# EasyEDA Pro project MSPM0G3507开发板（TI）.eprj

# Schematic Schematic1
Board Name: Board1; Create Date: 2024-08-09; Drawed: 坏厚米
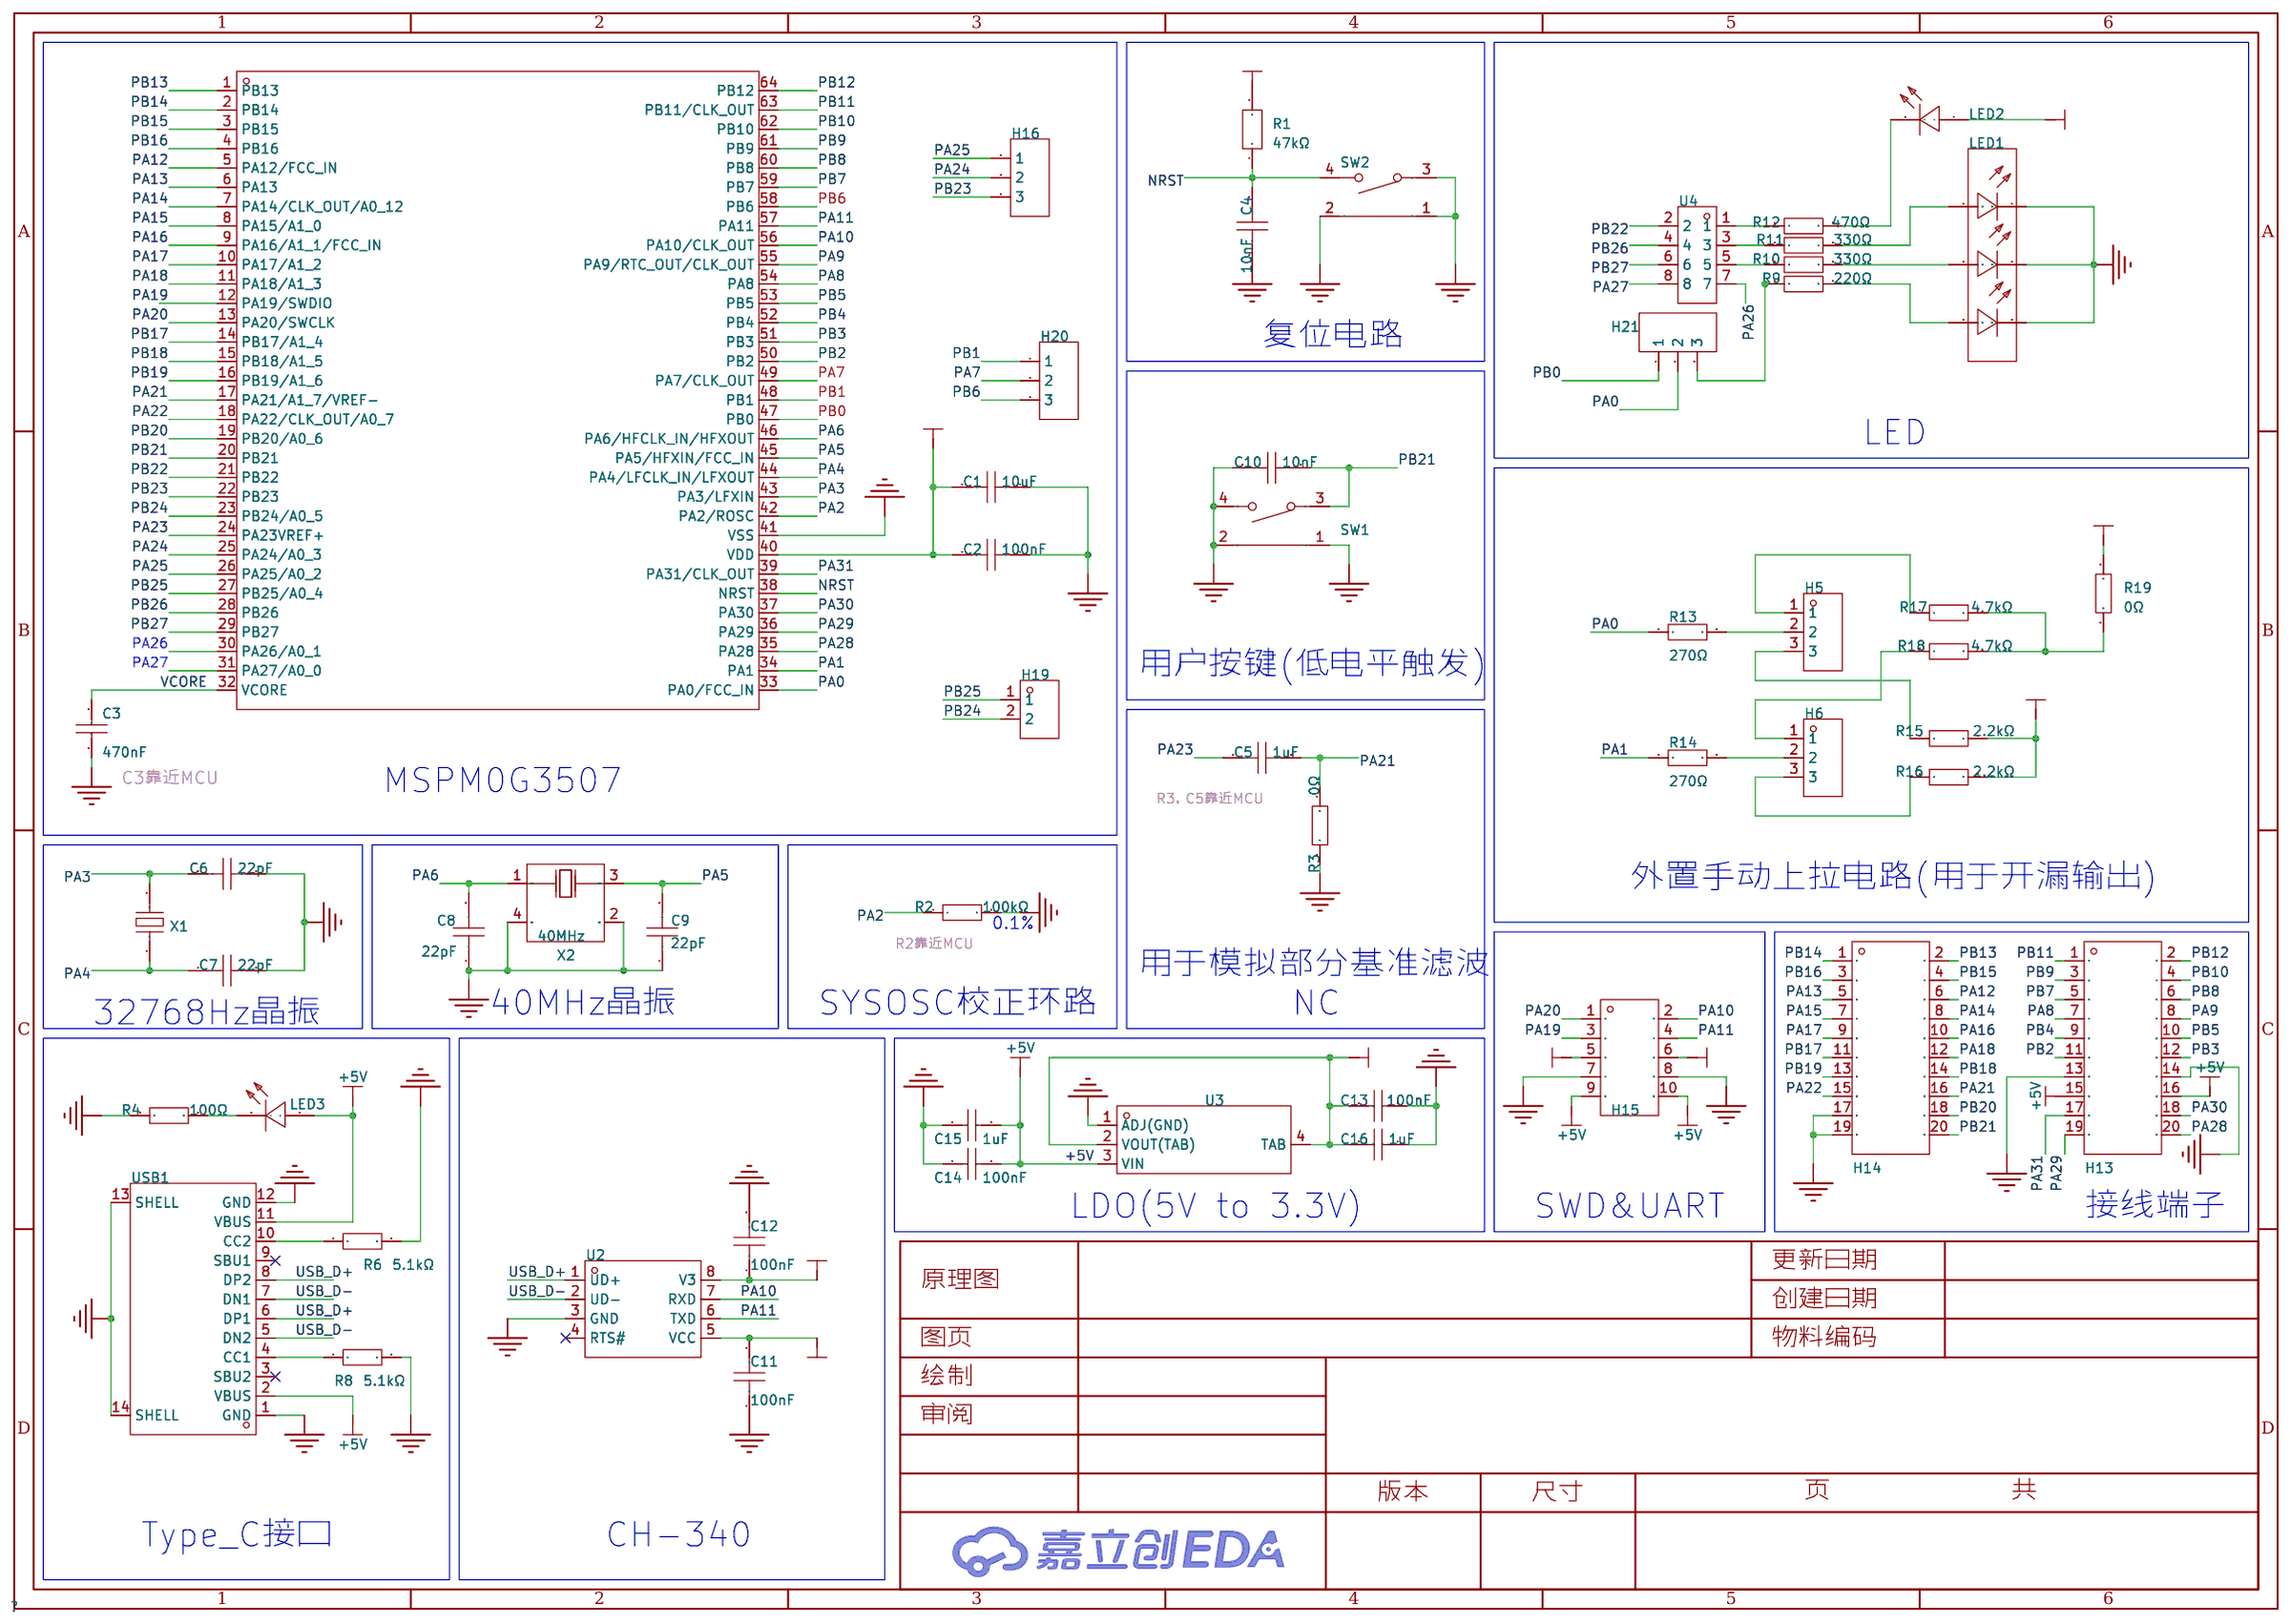
[diagram p0: schematic sheet]

## Parts
C1  10uF  [C0603]
C2  100nF  [C0603]
C3  470nF  [C0805]
C4  10nF  [C0805]
C5  1uF  [C0603]
C6  22pF  [C0805]
C7  22pF  [C0805]
C8  22pF  [C0805]
C9  22pF  [C0805]
C10  10nF  [C0805]
C11  100nF  [C0603]
C12  100nF  [C0603]
C13  100nF  [C0805]
C14  100nF  [C0805]
C15  1uF  [C0805]
C16  1uF  [C0805]
H5  PZ254V-11-03P  [HDR-TH_3P-P2.54-V-M]
H6  PZ254V-11-03P  [HDR-TH_3P-P2.54-V-M]
H13  X6521WV-2x10H-C60D30  [HDR-TH_20P-P2.54-V-M-R2-C10-S2.54]
H14  X6521WV-2x10H-C60D30  [HDR-TH_20P-P2.54-V-M-R2-C10-S2.54]
H15  PZ2.54-2*5  [HDR-TH_10P-P2.54-V-M-R2-C5-S2.54-1]
H16  2.54-1*3P针  [HDR-TH_3P-P2.54-V-M-1]
H19  KH-2.54PH180-1X2P-L11.5  [HDR-TH_2P-P2.54-V-M]
H20  2.54-1*3P针  [HDR-TH_3P-P2.54-V-M-1]
H21  2.54-1*3P针  [HDR-TH_3P-P2.54-V-M-1]
LED1  19-337/R6GHBHC-A01/2T  [LED-ARRAY-SMD_6P-L1.6-W1.6-TL]
LED2  NCD0805R1  [LED0805-R-RD]
LED3  NCD0805R1  [LED0805-R-RD]
R1  47kΩ  [R0805]
R2  100kΩ  [R0805]
R3  0Ω  [R0805]
R4  100Ω  [R0805]
R6  5.1kΩ  [R0603]
R8  5.1kΩ  [R0603]
R9  220Ω  [R0603]
R10  330Ω  [R0603]
R11  330Ω  [R0603]
R12  470Ω  [R0603]
R13  270Ω  [R0603]
R14  270Ω  [R0603]
R15  2.2kΩ  [R0805]
R16  2.2kΩ  [R0805]
R17  4.7kΩ  [R0603]
R18  4.7kΩ  [R0603]
R19  0Ω  [R0805]
SW1  TS24CA  [SW-SMD_TS24CA]
SW2  TS24CA  [SW-SMD_TS24CA]
U1  MSPM0G3507SPMR  [LQFP-64_L10.0-W10.0-P0.50-LS12.0-BL]
U2  CH340N  [SOP-8_L4.9-W3.9-P1.27-LS6.0-BL]
U3  AMS1117-3.3  [SOT-223-4_L6.5-W3.5-P2.30-LS7.0-BR]
U4  PZ2.54-2*4  [HDR-TH_8P-P2.54-V-M-R2-C4-S2.54]
USB1  TYPE-C 16PIN 2MD(073)  [USB-C-SMD_TYPE-C-6PIN-2MD-073]
X1  32.768kHz  [OSC-SMD_L3.2-W1.5]
X2  40MHz  [CRYSTAL-SMD_4P-L3.2-W2.5-BL]

## Library data of the parts
C1 = CL10A106MA8NRNC: 容值:10uF;精度:±20%;额定电压:25V;材质(温度系数):X5R;; LCSC Part Name: 10uF ±20% 25V; Supplier Part: C96446; Manufacturer: SAMSUNG(三星); Supplier Footprint: 0603; JLCPCB Part Class: 基础库; Datasheet: https://atta.szlcsc.com/upload/public/pdf/source/20160218/1457707763339.pdf; Supplier: LCSC; Tolerance: ±20%; Voltage Rated: 25V; Temperature Coefficient: X5R
C2 C11 C12 = CC0603KRX7R9BB104: 容值:100nF;精度:±10%;额定电压:50V;材质(温度系数):X7R;; LCSC Part Name: 100nF ±10% 50V; Supplier Part: C14663; Manufacturer: YAGEO(国巨); Supplier Footprint: 0603; JLCPCB Part Class: 基础库; Datasheet: https://atta.szlcsc.com/upload/public/pdf/source/20180910/C282072_33301C7F631E79921B82A8DAC6BCC5B3.pdf; Supplier: LCSC; Tolerance: ±10%; Voltage Rated: 50V; Temperature Coefficient: X7R
C3 = CC0805KKX7R9BB474: 容值:470nF;精度:±10%;额定电压:50V;材质(温度系数):X7R;; LCSC Part Name: 470nF ±10% 50V; Supplier Part: C106843; Manufacturer: YAGEO(国巨); Supplier Footprint: 0805; JLCPCB Part Class: 扩展库; Datasheet: https://atta.szlcsc.com/upload/public/pdf/source/20170919/C131031_1505787245477976978.pdf; Supplier: LCSC; Tolerance: ±10%; Voltage Rated: 50V; Temperature Coefficient: X7R
C4 C10 = CC0805KRX7R9BB103: 容值:10nF;精度:±10%;额定电压:50V;材质(温度系数):X7R;; LCSC Part Name: 10nF ±10% 50V; Supplier Part: C83170; Manufacturer: YAGEO(国巨); Supplier Footprint: 0805; JLCPCB Part Class: 扩展库; Datasheet: https://atta.szlcsc.com/upload/public/pdf/source/20170211/1486785656773.pdf; Supplier: LCSC; Tolerance: ±10%; Voltage Rated: 50V; Temperature Coefficient: X7R
C5 = CL10A105KB8NNNC: 容值:1uF;精度:±10%;额定电压:50V;材质(温度系数):X5R;; LCSC Part Name: 1uF ±10% 50V; Supplier Part: C15849; Manufacturer: SAMSUNG(三星); Supplier Footprint: 0603; JLCPCB Part Class: 基础库; Datasheet: https://atta.szlcsc.com/upload/public/pdf/source/20160218/1457707763339.pdf; Supplier: LCSC; Tolerance: ±10%; Voltage Rated: 50V; Temperature Coefficient: X5R
C6-C9 = CC0805FRNPO9BN220: 容值:22pF;精度:±1%;额定电压:50V;材质(温度系数):NP0;; LCSC Part Name: 22pF ±1% 50V; Supplier Part: C541515; Manufacturer: YAGEO(国巨); Supplier Footprint: 0805; JLCPCB Part Class: 扩展库; Datasheet: https://atta.szlcsc.com/upload/public/pdf/source/20200615/C541515_88B9BEA386E877B1A6E9F0AB558B8E25.pdf; Supplier: LCSC; Tolerance: ±1%; Voltage Rated: 50V; Temperature Coefficient: NP0
C13 C14 = CC0805KRX7R9BB104: 容值:100nF;精度:±10%;额定电压:50V;材质(温度系数):X7R;; LCSC Part Name: 100nF ±10% 50V; Supplier Part: C49678; Manufacturer: YAGEO(国巨); Supplier Footprint: 0805; JLCPCB Part Class: 基础库; Datasheet: https://atta.szlcsc.com/upload/public/pdf/source/20180224/C181747_15194369449651363981.pdf; Supplier: LCSC; Tolerance: ±10%; Voltage Rated: 50V; Temperature Coefficient: X7R
C15 C16 = CL21B105KBFNNNE: 容值:1uF;精度:±10%;额定电压:50V;材质(温度系数):X7R;; LCSC Part Name: 1uF ±10% 50V; Supplier Part: C28323; Manufacturer: SAMSUNG(三星); Supplier Footprint: 0805; JLCPCB Part Class: 基础库; Datasheet: https://atta.szlcsc.com/upload/public/pdf/source/20160218/1457707763339.pdf; Supplier: LCSC; Tolerance: ±10%; Voltage Rated: 50V; Temperature Coefficient: X7R
H5 H6 = PZ254V-11-03P: 插针结构:1x3P;间距:2.54mm;行距:-;圆针/方针:方针;安装类型:直插;排数:单排;总PIN位数:3P;额定电流:3A;额定电压:250V;配合针长度:6mm;塑高:2.5mm;端接针长度:3mm;工作温度范围:-40℃~+105℃;颜色:黑色;; LCSC Part Name: 间距:2.54mm 1x3P 直插 方针; Supplier Part: C2937625; Manufacturer: XFCN(兴飞); Supplier Footprint: 插件,P=2.54mm; JLCPCB Part Class: 扩展库; Datasheet: https://atta.szlcsc.com/upload/public/pdf/source/20200309/C492402_8335C3D49C4E4C618838D59BB1D024C1.pdf; Supplier: LCSC; Pin Structure: 1x3P; Pitch: 2.54mm; Circluar Pins/Square Pins: 方针; Mounting Type: 直插; Number of Rows: 单排; Number of Pins: 3P; Current Rating (Max): 3A; Voltage Rating (Max): 250V; Length of Mating Pin: 6mm; Insulation Height: 2.5mm; Length of End Connection Pin: 3mm; Operating Temperature Range: -40℃~+105℃; Color: 黑色
H13 H14 = X6521WV-2x10H-C60D30: 插针结构:2x10P;间距:2.54mm;行距:2.54mm;圆针/方针:方针;安装类型:-;排数:双排;总PIN位数:20P;额定电流:3A;额定电压:250V;配合针长度:-;塑高:2.5mm;端接针长度:-;触头材质:黄铜;触头镀层:金;工作温度范围:-40℃~+105℃;焊接温度(最大值):260℃;颜色:黑色;; LCSC Part Name: 2x10P 间距:2.54mm 方针; Supplier Part: C706900; Manufacturer: XKB Connection(中国星坤); Supplier Footprint: 插件,P=2.54mm; JLCPCB Part Class: 扩展库; Datasheet: https://atta.szlcsc.com/upload/public/pdf/source/20240506/64134E73DB35DA9A421C824B04192394.pdf; Supplier: LCSC; Pin Structure: 2x10P; Pitch: 2.54mm; Row Spacing: 2.54mm; Circluar Pins/Square Pins: 方针; Number of Rows: 双排; Number of Pins: 20P; Current Rating (Max): 3A; Voltage Rating (Max): 250V; Insulation Height: 2.5mm; Contact Material: 黄铜; Contact Plating: 金; Operating Temperature Range: -40℃~+105℃; Soldering Temperature(Max): 260℃; Color: 黑色
H15 = PZ2.54-2*5: 插针结构:2x5P;间距:2.54mm;排数:双排;总PIN位数:10P;; Supplier: LCSC; Supplier Part: C5156677; Manufacturer: ZHOURI(洲日); JLCPCB Part Class: 扩展库; Supplier Footprint: 插件,P=2.54mm; Datasheet: https://atta.szlcsc.com/upload/public/pdf/source/20220923/FF9D303E4B04AC19FF78D5B876650950.pdf; Pin Structure: 2x5P; Pitch: 2.54mm; Number of Rows: 双排; Number of Pins: 10P
H16 H20 H21 = 2.54-1*3P针: 插针结构:1x3P;间距:2.54mm;行距:-;圆针/方针:方针;安装类型:直插;排数:单排;总PIN位数:3P;额定电流:3A;额定电压:-;配合针长度:-;塑高:-;端接针长度:-;触头材质:-;触头镀层:-;工作温度范围:-40℃~+105℃;颜色:黑色;; LCSC Part Name: 间距:2.54mm 1x3P 直插 方针; Supplier Part: C49257; Manufacturer: BOOMELE(博穆精密); Supplier Footprint: 插件,P=2.54mm; JLCPCB Part Class: 扩展库; Datasheet: https://atta.szlcsc.com/upload/public/pdf/source/20221018/3E9408392E35E6F57A28985E5F7BF5C9.pdf; Supplier: LCSC; Pin Structure: 1x3P; Pitch: 2.54mm; Circluar Pins/Square Pins: 方针; Mounting Type: 直插; Number of Rows: 单排; Number of Pins: 3P; Current Rating (Max): 3A; Operating Temperature Range: -40℃~+105℃; Color: 黑色
H19 = KH-2.54PH180-1X2P-L11.5: 插针结构:1x2P;间距:2.54mm;行距:-;圆针/方针:方针;安装类型:直插;排数:单排;总PIN位数:2P;额定电流:3A;额定电压:-;配合针长度:6mm;塑高:2.5mm;端接针长度:3mm;触头材质:-;工作温度范围:-40℃~+105℃;颜色:黑色;; LCSC Part Name: 间距:2.54mm 1x2P 直插 方针; Supplier Part: C2905434; Manufacturer: kinghelm(金航标); Supplier Footprint: 插件,P=2.54mm; JLCPCB Part Class: 扩展库; Datasheet: https://atta.szlcsc.com/upload/public/pdf/source/20211019/75EAF9E0823F75B5BB441C07BAE9F5E6.pdf; Supplier: LCSC; Pin Structure: 1x2P; Pitch: 2.54mm; Circluar Pins/Square Pins: 方针; Mounting Type: 直插; Number of Rows: 单排; Number of Pins: 2P; Current Rating (Max): 3A; Length of Mating Pin: 6mm; Insulation Height: 2.5mm; Length of End Connection Pin: 3mm; Operating Temperature Range: -40℃~+105℃; Color: 黑色
LED1 = 19-337/R6GHBHC-A01/2T: LCSC Part Name: RGB三色; Supplier Part: C264519; Manufacturer: EVERLIGHT(亿光); Supplier Footprint: 0606; JLCPCB Part Class: 扩展库; Datasheet: https://atta.szlcsc.com/upload/public/pdf/source/20180817/C264519_7900C9A62A83B27DE10B455F7A4B7339.pdf; Supplier: LCSC
LED2 LED3 = NCD0805R1: 灯头类型:-;发光颜色:红色;正向电压(VF):1.6V~2.6V;功率:65mW;正向电流:20mA;主波长:615nm~630nm;二极管配置:独立二极管;透镜颜色:无色透明透镜;色温:-;发光强度:67mcd~195mcd;发光角度:130°;载带方式:-;工作温度:-30℃~+85℃;; Supplier Part: C84256; Manufacturer: 国星光电; Supplier Footprint: 0805; JLCPCB Part Class: 基础库; Datasheet: https://atta.szlcsc.com/upload/public/pdf/source/20200820/C84256_F0A75A43B3EAD75808600A0514C76B99.pdf; Supplier: LCSC; Emitted Color: 红色; Forward Voltage (VF): 1.6V~2.6V; Power Dissipation: 65mW; Forward Current: 20mA; Dominant Wavelength: 615nm~630nm; Diode Configuration: 独立二极管; Lens Color: 无色透明透镜; Luminous Intensity: 67mcd~195mcd; Viewing Angle: 130°; Operating Temperature: -30℃~+85℃
R1 = SCR0805F47K: 电阻类型:厚膜电阻;阻值:47kΩ;精度:±1%;功率:125mW;最大工作电压:150V;; LCSC Part Name: 厚膜电阻 47kΩ ±1% 125mW; Supplier Part: C3016793; Manufacturer: VO(翔胜); Supplier Footprint: 0805; JLCPCB Part Class: 扩展库; Datasheet: https://atta.szlcsc.com/upload/public/pdf/source/20220513/247AF9639BA21CF93567DC289CCC6A22.pdf; Supplier: LCSC; Type: 厚膜电阻; Tolerance: ±1%; Power(Watts): 125mW; Overload Voltage (Max): 150V; Operating Temperature Range: -55℃~+155℃
R2 = RT0805BRD07100KL: 电阻类型:薄膜电阻;阻值:100kΩ;精度:±0.1%;功率:125mW;最大工作电压:150V;温度系数:±25ppm/℃;; LCSC Part Name: 薄膜电阻 100kΩ ±0.1% 125mW; Supplier Part: C122537; Manufacturer: YAGEO(国巨); Supplier Footprint: 0805; JLCPCB Part Class: 扩展库; Datasheet: https://atta.szlcsc.com/upload/public/pdf/source/20170721/C122537_1500619325668834091.pdf; Supplier: LCSC; Type: 薄膜电阻; Tolerance: ±0.1%; Power(Watts): 125mW; Overload Voltage (Max): 150V; Temperature Coefficient: ±25ppm/℃; Operating Temperature Range: -55℃~+155℃
R3 R19 = 0805W8F0000T5E: 电阻类型:厚膜电阻;阻值:0Ω;精度:±1%;功率:125mW;最大工作电压:150V;温度系数:±800ppm/℃;; LCSC Part Name: 0Ω ±1% 125mW 厚膜电阻; Supplier Part: C17477; Manufacturer: UNI-ROYAL(厚声); Supplier Footprint: 0805; JLCPCB Part Class: 基础库; Datasheet: https://atta.szlcsc.com/upload/public/pdf/source/20200306/C422600_1E6D84923E4A46A82E41ADD87F860B5C.pdf; Supplier: LCSC; Type: 厚膜电阻; Tolerance: ±1%; Power(Watts): 125mW; Overload Voltage (Max): 150V; Temperature Coefficient: ±800ppm/℃; Operating Temperature Range: -55℃~+155℃
R4 = 0805W8F1000T5E: 电阻类型:厚膜电阻;阻值:100Ω;精度:±1%;功率:125mW;最大工作电压:150V;温度系数:±100ppm/℃;; LCSC Part Name: 100Ω ±1% 125mW 厚膜电阻; Supplier Part: C17408; Manufacturer: UNI-ROYAL(厚声); Supplier Footprint: 0805; JLCPCB Part Class: 基础库; Datasheet: https://atta.szlcsc.com/upload/public/pdf/source/20200306/C422600_1E6D84923E4A46A82E41ADD87F860B5C.pdf; Supplier: LCSC; Type: 厚膜电阻; Tolerance: ±1%; Power(Watts): 125mW; Overload Voltage (Max): 150V; Temperature Coefficient: ±100ppm/℃; Operating Temperature Range: -55℃~+155℃
R6 R8 = 0603WAF5101T5E: 电阻类型:厚膜电阻;阻值:5.1kΩ;精度:±1%;功率:100mW;最大工作电压:75V;温度系数:±100ppm/℃;; LCSC Part Name: 5.1kΩ ±1% 100mW 厚膜电阻; Supplier Part: C23186; Manufacturer: UNI-ROYAL(厚声); Supplier Footprint: 0603; JLCPCB Part Class: 基础库; Datasheet: https://atta.szlcsc.com/upload/public/pdf/source/20200306/C422600_1E6D84923E4A46A82E41ADD87F860B5C.pdf; Supplier: LCSC; Type: 厚膜电阻; Tolerance: ±1%; Power(Watts): 100mW; Overload Voltage (Max): 75V; Temperature Coefficient: ±100ppm/℃; Operating Temperature Range: -55℃~+155℃
R9 = 0603WAF2200T5E: 电阻类型:厚膜电阻;阻值:220Ω;精度:±1%;功率:100mW;最大工作电压:75V;温度系数:±100ppm/℃;; LCSC Part Name: 220Ω ±1% 100mW 厚膜电阻; Supplier Part: C22962; Manufacturer: UNI-ROYAL(厚声); Supplier Footprint: 0603; JLCPCB Part Class: 基础库; Datasheet: https://atta.szlcsc.com/upload/public/pdf/source/20200306/C422600_1E6D84923E4A46A82E41ADD87F860B5C.pdf; Supplier: LCSC; Type: 厚膜电阻; Tolerance: ±1%; Power(Watts): 100mW; Overload Voltage (Max): 75V; Temperature Coefficient: ±100ppm/℃; Operating Temperature Range: -55℃~+155℃
R10 R11 = 0603WAF3300T5E: 电阻类型:厚膜电阻;阻值:330Ω;精度:±1%;功率:100mW;最大工作电压:75V;温度系数:±100ppm/℃;; LCSC Part Name: 330Ω ±1% 100mW 厚膜电阻; Supplier Part: C23138; Manufacturer: UNI-ROYAL(厚声); Supplier Footprint: 0603; JLCPCB Part Class: 基础库; Datasheet: https://atta.szlcsc.com/upload/public/pdf/source/20200306/C422600_1E6D84923E4A46A82E41ADD87F860B5C.pdf; Supplier: LCSC; Type: 厚膜电阻; Tolerance: ±1%; Power(Watts): 100mW; Overload Voltage (Max): 75V; Temperature Coefficient: ±100ppm/℃; Operating Temperature Range: -55℃~+155℃
R12 = 0603WAF4700T5E: 电阻类型:厚膜电阻;阻值:470Ω;精度:±1%;功率:100mW;最大工作电压:75V;温度系数:±100ppm/℃;; LCSC Part Name: 470Ω ±1% 100mW 厚膜电阻; Supplier Part: C23179; Manufacturer: UNI-ROYAL(厚声); Supplier Footprint: 0603; JLCPCB Part Class: 基础库; Datasheet: https://atta.szlcsc.com/upload/public/pdf/source/20200306/C422600_1E6D84923E4A46A82E41ADD87F860B5C.pdf; Supplier: LCSC; Type: 厚膜电阻; Tolerance: ±1%; Power(Watts): 100mW; Overload Voltage (Max): 75V; Temperature Coefficient: ±100ppm/℃; Operating Temperature Range: -55℃~+155℃
R13 R14 = 0603WAF2700T5E: 电阻类型:厚膜电阻;阻值:270Ω;精度:±1%;功率:100mW;最大工作电压:75V;温度系数:±100ppm/℃;; LCSC Part Name: 270Ω ±1% 100mW 厚膜电阻; Supplier Part: C22966; Manufacturer: UNI-ROYAL(厚声); Supplier Footprint: 0603; JLCPCB Part Class: 基础库; Datasheet: https://atta.szlcsc.com/upload/public/pdf/source/20200306/C422600_1E6D84923E4A46A82E41ADD87F860B5C.pdf; Supplier: LCSC; Type: 厚膜电阻; Tolerance: ±1%; Power(Watts): 100mW; Overload Voltage (Max): 75V; Temperature Coefficient: ±100ppm/℃; Operating Temperature Range: -55℃~+155℃
R15 R16 = 0805W8F2201T5E: 电阻类型:厚膜电阻;阻值:2.2kΩ;精度:±1%;功率:125mW;最大工作电压:150V;温度系数:±100ppm/℃;; LCSC Part Name: 2.2kΩ ±1% 125mW 厚膜电阻; Supplier Part: C17520; Manufacturer: UNI-ROYAL(厚声); Supplier Footprint: 0805; JLCPCB Part Class: 基础库; Datasheet: https://atta.szlcsc.com/upload/public/pdf/source/20200306/C422600_1E6D84923E4A46A82E41ADD87F860B5C.pdf; Supplier: LCSC; Type: 厚膜电阻; Tolerance: ±1%; Power(Watts): 125mW; Overload Voltage (Max): 150V; Temperature Coefficient: ±100ppm/℃; Operating Temperature Range: -55℃~+155℃
R17 R18 = RC0603FR-074K7L: 电阻类型:厚膜电阻;阻值:4.7kΩ;精度:±1%;功率:100mW;最大工作电压:75V;温度系数:±100ppm/℃;; LCSC Part Name: 厚膜电阻 4.7kΩ ±1% 100mW; Supplier Part: C99782; Manufacturer: YAGEO(国巨); Supplier Footprint: 0603; JLCPCB Part Class: 扩展库; Datasheet: https://atta.szlcsc.com/upload/public/pdf/source/20180224/C181757_15194369480721363983.pdf; Supplier: LCSC; Type: 厚膜电阻; Tolerance: ±1%; Power(Watts): 100mW; Overload Voltage (Max): 75V; Temperature Coefficient: ±100ppm/℃; Operating Temperature Range: -55℃~+155℃
SW1 SW2 = TS24CA: 电路结构:单刀单掷;按钮形状:矩形按钮;安装方式:卧贴;开关长度:4.55mm;开关宽度:1.8mm;开关高度:3.5mm;触点电流:50mA;额定电压(DC):12V;带灯:-;机械寿命:-;; LCSC Part Name: 4.55*1.8*3.5mm 卧贴 轻触开关; Supplier Part: C393942; Manufacturer: SHOU HAN(首韩); Supplier Footprint: SMD; JLCPCB Part Class: 扩展库; Datasheet: https://atta.szlcsc.com/upload/public/pdf/source/20190521/C393942_591A9E318887EFA4274D34029981AD99.pdf; Supplier: LCSC; Circuit: 单刀单掷; Actuator Style: 矩形按钮; Mounting Style: 卧贴; Switch Length: 4.55mm; Switch Width: 1.8mm; Switch Height: 3.5mm; Contact Current: 50mA; Voltage Rating (DC): 12V
U1 = MSPM0G3507SPMR_C22389960: Supplier Part: C22389960; Manufacturer: TI(德州仪器); Supplier Footprint: LQFP-64(10x10); JLCPCB Part Class: 扩展库; Datasheet: https://atta.szlcsc.com/upload/public/pdf/source/20240621/D7254EAE03B6DB9B67DC0EA221DC405D.pdf; Supplier: LCSC
U2 = CH340N: LCSC Part Name: USB转串口芯片 CH340; Supplier Part: C2977777; Manufacturer: WCH(南京沁恒); Supplier Footprint: SOP-8; JLCPCB Part Class: 扩展库; Datasheet: https://atta.szlcsc.com/upload/public/pdf/source/20230530/6E401E9554E9F5311886CC8B3F89B62E.pdf; Supplier: LCSC
U3 = AMS1117-3.3_C347222: 输出类型:固定;最大输入电压:12V;输出电压:3.3V;最大输出电流:1A;电源纹波抑制比(PSRR):60dB@(120Hz);输出极性:正极;; LCSC Part Name: 输出:3.3V 电流:1A 耐压:12V; Supplier Part: C347222; Manufacturer: UMW(友台半导体); Supplier Footprint: SOT-223; JLCPCB Part Class: 扩展库; Datasheet: https://atta.szlcsc.com/upload/public/pdf/source/20231109/155D79A26D9DB04352555A58D5969DC8.pdf; Supplier: LCSC; Output Type: 固定; Maximum Input Voltage: 12V; Output Voltage: 3.3V; MAX Output Current: 1A; Power Supply Rejection Ratio (PSRR): 60dB@(120Hz); Dropout Voltage: 1.3V@(1A); Output Polarity: 正极; Number of Outputs: 1
U4 = PZ2.54-2*4: 插针结构:2x4P;间距:2.54mm;排数:双排;总PIN位数:8P;; Supplier Part: C5156676; Manufacturer: ZHOURI(洲日); Supplier Footprint: 插件,P=2.54mm; JLCPCB Part Class: 扩展库; Datasheet: https://atta.szlcsc.com/upload/public/pdf/source/20220923/0E7A4A94740FFD503E2D73F36F92C1EA.pdf; Supplier: LCSC; Pin Structure: 2x4P; Pitch: 2.54mm; Number of Rows: 双排; Number of Pins: 8P
USB1 = TYPE-C 16PIN 2MD(073): 连接器类型:Type-C;标准:-;公母:母;端口数量:1;触点数量:16P;安装方式:卧贴;额定电流 - 电源:5A;工作温度范围:-25℃~+85℃;; LCSC Part Name: Type-C 母 卧贴; Supplier Part: C2765186; Manufacturer: SHOU HAN(首韩); Supplier Footprint: SMD; JLCPCB Part Class: 扩展库; Datasheet: https://atta.szlcsc.com/upload/public/pdf/source/20211123/39B17C16241EAC15C5E277BDA434118E.pdf; Supplier: LCSC; Connector Type: Type-C; Gender: 母; Number of Ports: 1; Number of Contacts: 16P; Mounting Style: 卧贴; Current Rating - Power (Max): 5A; Operating Temperature Range: -25℃~+85℃
X1 = X321532768KGD2SI: 晶振类型:贴片晶振;频率:32.768kHz;常温频差:±20ppm;外接负载电容:12.5pF;频率稳定度(全温):-;; LCSC Part Name: 32.768kHz ±20ppm 12.5pF; Supplier Part: C620155; Manufacturer: YXC(扬兴晶振); Supplier Footprint: SMD3215-2P; JLCPCB Part Class: 扩展库; Datasheet: https://atta.szlcsc.com/upload/public/pdf/source/20240329/3A7650FD985DD0DE85694D3785AB4916.pdf; Supplier: LCSC; Crystal Type: 贴片晶振; Normal temperature Frequency Tolerance: ±20ppm; External load capacitor: 12.5pF; Operating Temperature: -40℃~+85℃
X2 = S3240000121040: 晶振类型:贴片晶振;频率:40MHz;常温频差:±10ppm;外接负载电容:12pF;; LCSC Part Name: 40MHz ±10ppm 12pF; Supplier Part: C426989; Manufacturer: JGHC(晶光华); Supplier Footprint: SMD3225-4P; JLCPCB Part Class: 扩展库; Datasheet: https://atta.szlcsc.com/upload/public/pdf/source/20191012/C431172_99BCDFC5E39E114929AE7F9C9DED2B9F.pdf; Supplier: LCSC; Crystal Type: 贴片晶振; Normal temperature Frequency Tolerance: ±10ppm; External load capacitor: 12pF; Equivalent Series Resistance (ESR): 40Ω; Operating Temperature: -40℃~+85℃

## Nets
3V3: C1.2 C2.2 C11.2 C12.1 C13.2 C16.2 H15.5 H15.6 LED2.1(+) R1.2 R15.2 R16.2 U1.40(VDD) U2.5(VCC) U2.8(V3) U3.2(VOUT(TAB)) U3.4(TAB)
+5V: C14.1 C15.1 H13.15 H13.16 H15.9 H15.10 LED3.1(+) R19.2 U3.3(VIN) USB1.2(VBUS) USB1.11(VBUS)
GND: C1.1 C2.1 C3.1 C4.1 C6.2 C7.2 C8.1 C9.1 C10.2 C11.1 C12.2 C13.1 C14.2 C15.2 C16.1 H13.13 H13.14 H14.17 H14.19 H15.7 H15.8 LED1.1(-B) LED1.2(-R) LED1.3(-G) R2.2 R3.1 R4.1 R6.2 R8.2 SW1.1 SW1.2 SW1.4 SW2.1 SW2.2 SW2.3 U1.41(VSS) U2.3(GND) U3.1(ADJ(GND)) USB1.1(GND) USB1.12(GND) USB1.13(SHELL) USB1.14(SHELL) X2.2(GND) X2.4(OSC1)
NRST: C4.2 R1.1 SW2.4 U1.38(NRST)
PA0: H21.2 R13.1 U1.33(PA0/FCC_IN)
PA1: R14.1 U1.34(PA1)
PA2: R2.1 U1.42(PA2/ROSC)
PA3: C6.1 U1.43(PA3/LFXIN) X1.2
PA4: C7.1 U1.44(PA4/LFCLK_IN/LFXOUT) X1.1
PA5: C9.2 U1.45(PA5/HFXIN/FCC_IN) X2.3(OSC2)
PA6: C8.2 U1.46(PA6/HFCLK_IN/HFXOUT) X2.1(GND)
PA7: H20.2 U1.49(PA7/CLK_OUT)
PA8: H13.7 U1.54(PA8)
PA9: H13.8 U1.55(PA9/RTC_OUT/CLK_OUT)
PA10: H15.2 U1.56(PA10/CLK_OUT) U2.7(RXD)
PA11: H15.4 U1.57(PA11) U2.6(TXD)
PA12: H14.6 U1.5(PA12/FCC_IN)
PA13: H14.5 U1.6(PA13)
PA14: H14.8 U1.7(PA14/CLK_OUT/A0_12)
PA15: H14.7 U1.8(PA15/A1_0)
PA16: H14.10 U1.9(PA16/A1_1/FCC_IN)
PA17: H14.9 U1.10(PA17/A1_2)
PA18: H14.12 U1.11(PA18/A1_3)
PA19: H15.3 U1.12(PA19/SWDIO)
PA20: H15.1 U1.13(PA20/SWCLK)
PA21: C5.2 H14.16 R3.2 U1.17(PA21/A1_7/VREF-)
PA22: H14.15 U1.18(PA22/CLK_OUT/A0_7)
PA23: C5.1 U1.24(PA23VREF+)
PA24: H16.2 U1.25(PA24/A0_3)
PA25: H16.1 U1.26(PA25/A0_2)
PA26: U1.30(PA26/A0_1) U4.7
PA27: U1.31(PA27/A0_0) U4.8
PA28: H13.20 U1.35(PA28)
PA29: H13.19 U1.36(PA29)
PA30: H13.18 U1.37(PA30)
PA31: H13.17 U1.39(PA31/CLK_OUT)
PB0: H21.1 U1.47(PB0)
PB1: H20.1 U1.48(PB1)
PB2: H13.11 U1.50(PB2)
PB3: H13.12 U1.51(PB3)
PB4: H13.9 U1.52(PB4)
PB5: H13.10 U1.53(PB5)
PB6: H20.3 U1.58(PB6)
PB7: H13.5 U1.59(PB7)
PB8: H13.6 U1.60(PB8)
PB9: H13.3 U1.61(PB9)
PB10: H13.4 U1.62(PB10)
PB11: H13.1 U1.63(PB11/CLK_OUT)
PB12: H13.2 U1.64(PB12)
PB13: H14.2 U1.1(PB13)
PB14: H14.1 U1.2(PB14)
PB15: H14.4 U1.3(PB15)
PB16: H14.3 U1.4(PB16)
PB17: H14.11 U1.14(PB17/A1_4)
PB18: H14.14 U1.15(PB18/A1_5)
PB19: H14.13 U1.16(PB19/A1_6)
PB20: H14.18 U1.19(PB20/A0_6)
PB21: C10.1 H14.20 SW1.3 U1.20(PB21)
PB22: U1.21(PB22) U4.2
PB23: H16.3 U1.22(PB23)
PB24: H19.2 U1.23(PB24/A0_5)
PB25: H19.1 U1.27(PB25/A0_4)
PB26: U1.28(PB26) U4.4
PB27: U1.29(PB27) U4.6
USB_D+: U2.1(UD+) USB1.6(DP1) USB1.8(DP2)
USB_D-: U2.2(UD-) USB1.5(DN2) USB1.7(DN1)
VCORE: C3.2 U1.32(VCORE)
$1N5655: LED2.2(-) R12.2
$1N5659: H5.2 R13.2
$1N5660: H6.2 R14.2
$1N5661: H6.1 R18.1
$1N5662: H5.3 R15.1
$1N5663: H6.3 R16.1
$1N5664: H5.1 R17.1
$1N5665: R17.2 R18.2 R19.1
$1N8212: R6.1 USB1.10(CC2)
$1N8214: R8.1 USB1.4(CC1)
$1N9211: LED3.2(-) R4.2
$1N9475: LED1.4(+B) R11.2
$1N9580: R12.1 U4.1
$1N9585: R11.1 U4.3
$1N9590: R10.1 U4.5
$1N9737: LED1.5(+R) R10.2
$1N9759: LED1.6(+G) R9.2
$1N18300: H21.3 R9.1

Not connected (* = marked no-connect by the designer): U2 4(RTS#)*; USB1 3(SBU2)* 9(SBU1)*

## Notes on the sheet
- 复位电路
- LED
- 用户按键(低电平触发)
- C3靠近MCU
- MSPM0G3507
- R3，C5靠近MCU
- 外置手动上拉电路(用于开漏输出)
- 0.1%
- R2靠近MCU
- 用于模拟部分基准滤波
- 32768Hz晶振
- 40MHz晶振
- SYSOSC校正环路
- NC
- LDO(5V to 3.3V)
- SWD&UART
- 接线端子
- Type_C接口
- CH-340

# Board PCB1
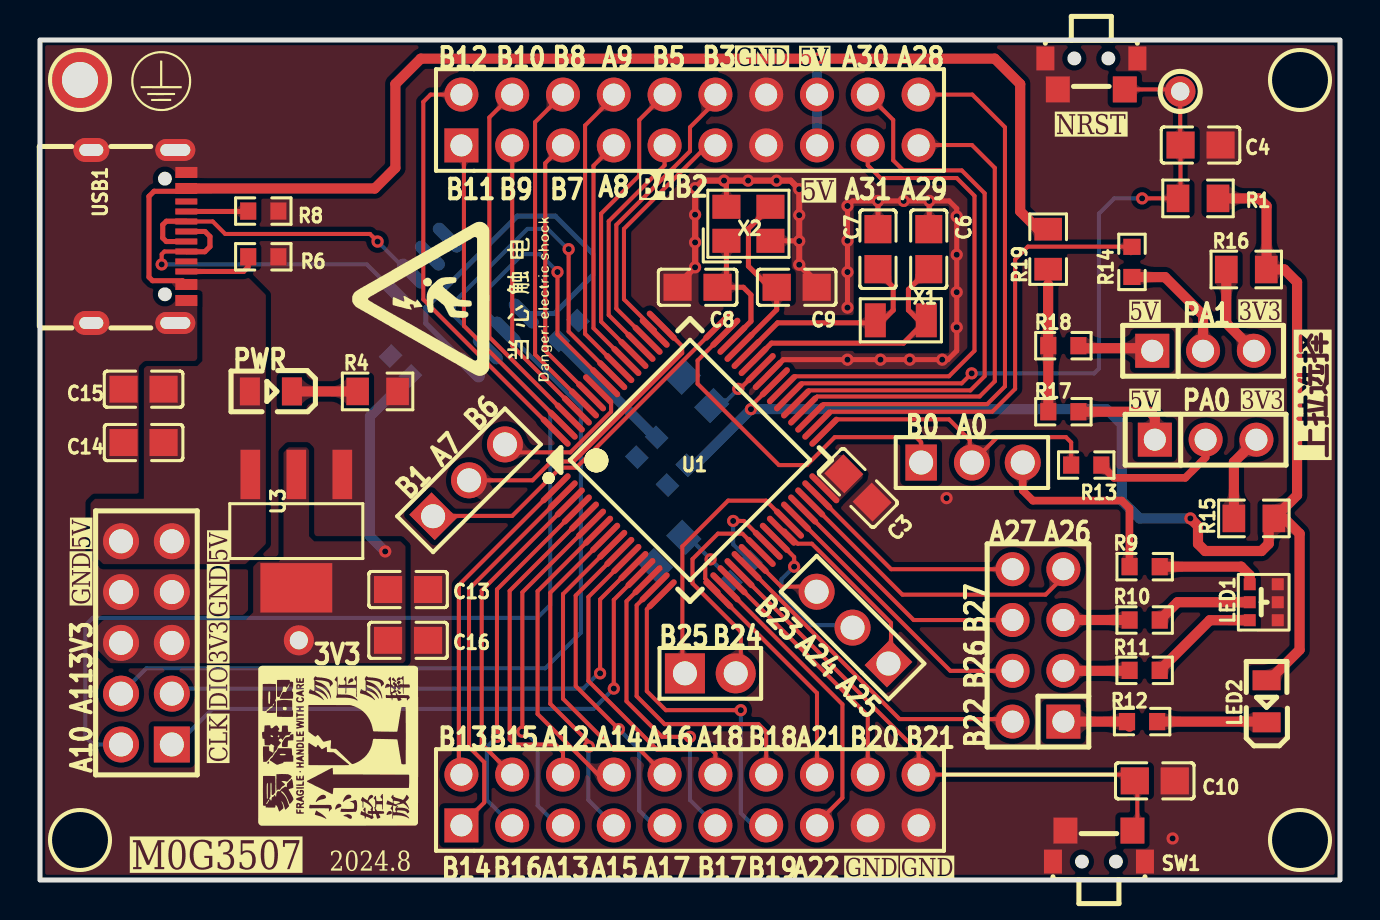
[diagram p1: board, top side]
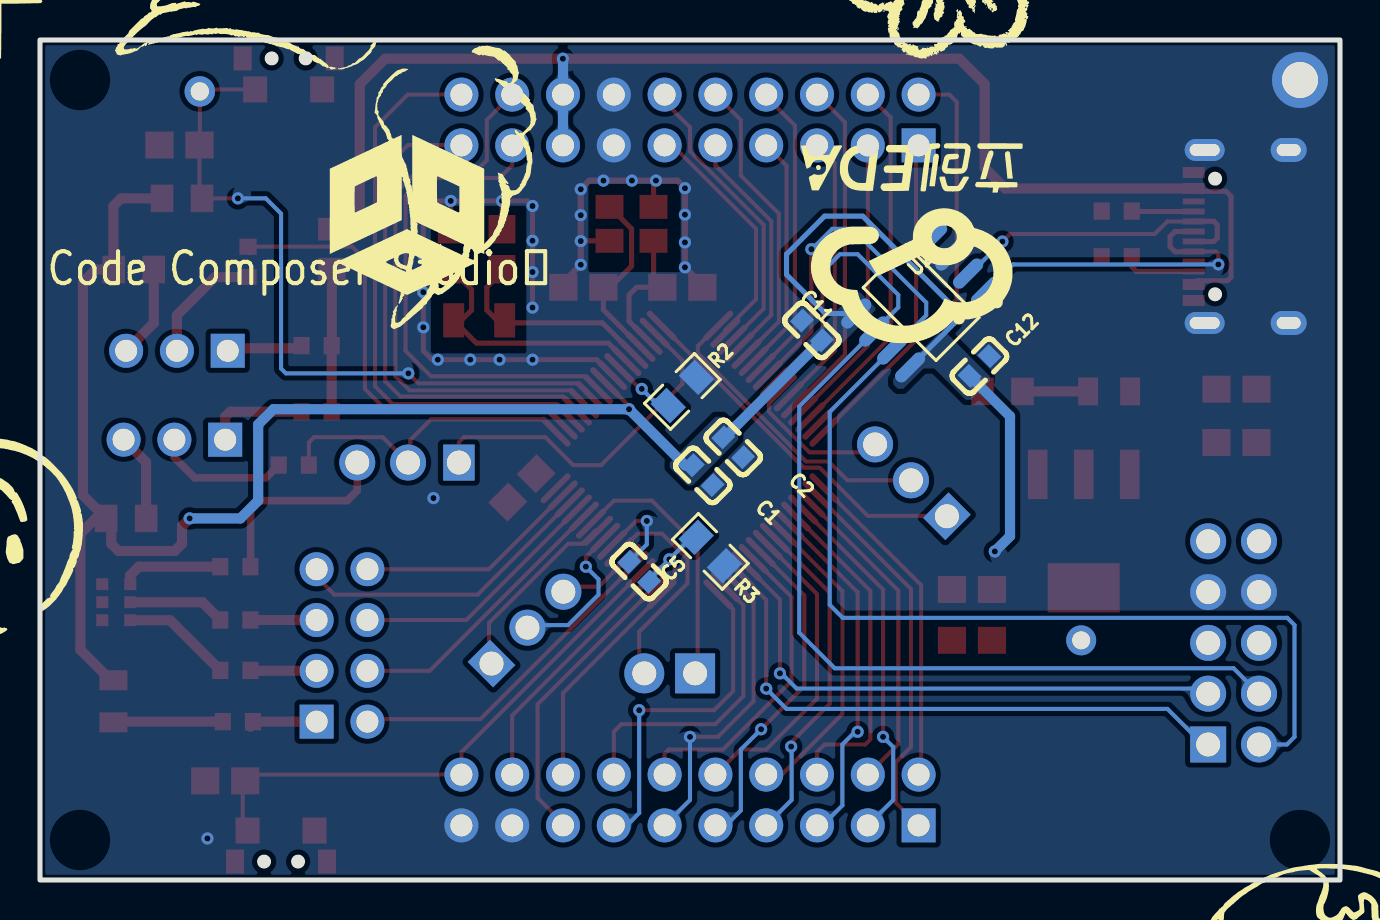
[diagram p2: board, bottom side, seen from below]

Outline 65 x 42 mm; copper layers: Top Layer, Bottom Layer. Coordinates in mm from the lower left corner of the outline.
Outline path: rectangle 0,42 65,0
Stack: Top Layer 0.035mm / Dielectric1 1.51mm FR4 er 4.5 / Bottom Layer 0.035mm

## Design rules (mm)
template: 自定义配置
spacing copperThickness1oz (default): track to track 0.102, other pairs 0.152 to 0.3
spacing copperThickness2oz: track to track 0.203, other pairs 0.152 to 0.3
track width copperThickness1oz (default): min 0.127, default 0.254, max 2.54
track width copperThickness2oz: min 0.203, default 0.254, max 2.54
differential pair differentialPair (default): width min 0.127, default 0.254, max 2.54; gap min 0.152, default 0.152
via viaSize (default): diameter min 0.5, default 0.61, max 10; hole min 0.3, default 0.305, max 6.3

## Placement (name value [footprint] x y rotation side)
C1  10uF  [C0603]  31.87 20.24 45 bottom
C2  100nF  [C0603]  30.34 21.64 45 bottom
C3  470nF  [C0805]  40.9 19.6 135 top
C4  10nF  [C0805]  58.03 36.75 180 top
C5  1uF  [C0603]  35.04 15.41 225 bottom
C6  22pF  [C0805]  44.44 31.54 90 top
C7  22pF  [C0805]  41.9 31.54 90 top
C8  22pF  [C0805]  32.88 29.64 0 top
C9  22pF  [C0805]  37.83 29.64 180 top
C10  10nF  [C0805]  55.74 4.96 0 top
C11  100nF  [C0603]  26.4 27.48 225 bottom
C12  100nF  [C0603]  18.02 25.7 135 bottom
C13  100nF  [C0805]  18.4 14.52 180 top
C14  100nF  [C0805]  5.18 21.87 180 top
C15  1uF  [C0805]  5.18 24.54 180 top
C16  1uF  [C0805]  18.4 11.98 180 top
H5  PZ254V-11-03P  [HDR-TH_3P-P2.54-V-M]  58.28 22.02 0 top
H6  PZ254V-11-03P  [HDR-TH_3P-P2.54-V-M]  58.15 26.46 0 top
H13  X6521WV-2x10H-C60D30  [HDR-TH_20P-P2.54-V-M-R2-C10-S2.54]  32.5 38 0 top
H14  X6521WV-2x10H-C60D30  [HDR-TH_20P-P2.54-V-M-R2-C10-S2.54]  32.5 4 0 top
H15  PZ2.54-2*5  [HDR-TH_10P-P2.54-V-M-R2-C5-S2.54-1]  5.32 11.86 90 top
H16  2.54-1*3P针  [HDR-TH_3P-P2.54-V-M-1]  40.63 12.62 135 top
H19  KH-2.54PH180-1X2P-L11.5  [HDR-TH_2P-P2.54-V-M]  33.52 10.33 0 top
H20  2.54-1*3P针  [HDR-TH_3P-P2.54-V-M-1]  21.45 19.98 45 top
H21  2.54-1*3P针  [HDR-TH_3P-P2.54-V-M-1]  46.6 20.87 0 top
LED1  19-337/R6GHBHC-A01/2T  [LED-ARRAY-SMD_6P-L1.6-W1.6-TL]  61.19 13.89 180 top
LED2  NCD0805R1  [LED0805-R-RD]  61.33 8.94 90 top
LED3  NCD0805R1  [LED0805-R-RD]  11.54 24.43 180 top
NOREF  -  [Pad_e2120]  12.94 11.98 0 top
NOREF#2  -  [Pad_e439]  57.01 39.43 0 top
NOREF#3  -  [Pad_e1911]  2 40 0 top
R1  47kΩ  [R0805]  57.9 34.08 0 top
R2  100kΩ  [R0805]  32.88 24.43 135 bottom
R3  0Ω  [R0805]  31.48 16.43 45 bottom
R4  100Ω  [R0805]  16.88 24.43 180 top
R6  5.1kΩ  [R0603]  11.16 31.16 0 top
R8  5.1kΩ  [R0603]  11.16 33.45 0 top
R9  220Ω  [R0603]  55.23 15.67 0 top
R10  330Ω  [R0603]  55.23 13 0 top
R11  330Ω  [R0603]  55.23 10.48 0 top
R12  470Ω  [R0603]  55.11 7.92 0 top
R13  270Ω  [R0603]  52.31 20.75 0 top
R14  270Ω  [R0603]  54.6 30.91 270 top
R15  2.2kΩ  [R0805]  60.69 18.08 0 top
R16  2.2kΩ  [R0805]  60.31 30.53 0 top
R17  4.7kΩ  [R0603]  51.17 23.41 180 top
R18  4.7kΩ  [R0603]  51.17 26.72 180 top
R19  0Ω  [R0805]  50.41 31.54 90 top
SW1  TS24CA  [SW-SMD_TS24CA]  52.95 1.7 180 top
SW2  TS24CA  [SW-SMD_TS24CA]  52.57 40.3 0 top
U1  MSPM0G3507SPMR  [LQFP-64_L10.0-W10.0-P0.50-LS12.0-BL]  32.5 21 315 top
U2  CH340N  [SOP-8_L4.9-W3.9-P1.27-LS6.0-BL]  20.94 28.87 45 bottom
U3  AMS1117-3.3  [SOT-223-4_L6.5-W3.5-P2.30-LS7.0-BR]  12.81 17.44 90 top
U4  PZ2.54-2*4  [HDR-TH_8P-P2.54-V-M-R2-C4-S2.54]  49.9 11.73 90 top
USB1  TYPE-C 16PIN 2MD(073)  [USB-C-SMD_TYPE-C-6PIN-2MD-073]  4.94 32.18 270 top
X1  32.768kHz  [OSC-SMD_L3.2-W1.5]  43.04 27.98 0 top
X2  40MHz  [CRYSTAL-SMD_4P-L3.2-W2.5-BL]  35.42 32.81 0 top

## Footprints (pads in the part's own frame, mm; a bottom-side part is the same pattern mirrored in y, then rotated)
C0603
  rect 0.8x0.9 smd: 1(-0.7,0) 2(0.7,0)
C0805
  rect 1.41x1.35 smd: 1(-1,0) 2(1,0)
CRYSTAL-SMD_4P-L3.2-W2.5-BL
  rect 1.4x1.2 smd: 1(-1.1,-0.85) 2(1.1,-0.85) 3(1.1,0.85) 4(-1.1,0.85)
HDR-TH_2P-P2.54-V-M
  rect 2x2 hole 1.2: 1(-1.27,0)
  round 2 hole 1.2: 2(1.27,0)
HDR-TH_3P-P2.54-V-M
  rect 1.7x1.7 hole 1.1: 1(-2.54,0)
  round 1.7 hole 1.1: 2(0,0) 3(2.54,0)
HDR-TH_3P-P2.54-V-M-1
  rect 1.575x1.8 hole 1.2: 1(-2.54,0)
  round 1.8 hole 1.2: 2(0,0) 3(2.54,0)
HDR-TH_8P-P2.54-V-M-R2-C4-S2.54
  rect 1.7x1.7 hole 1.1: 1(-3.81,-1.27)
  round 1.7 hole 1.1: 2(-3.81,1.27) 3(-1.27,-1.27) 4(-1.27,1.27) 5(1.27,-1.27) 6(1.27,1.27) 7(3.81,-1.27) 8(3.81,1.27)
HDR-TH_10P-P2.54-V-M-R2-C5-S2.54-1
  rect 1.8x1.8 hole 1.2: 1(-5.08,-1.27)
  round 1.8 hole 1.2: 2(-5.08,1.27) 3(-2.54,-1.27) 4(-2.54,1.27) 5(0,-1.27) 6(0,1.27) 7(2.54,-1.27) 8(2.54,1.27) 9(5.08,-1.27) 10(5.08,1.27)
HDR-TH_20P-P2.54-V-M-R2-C10-S2.54
  rect 1.7x1.7 hole 1.1: 1(-11.43,-1.27)
  round 1.7 hole 1.1: 2(-11.43,1.27) 3(-8.89,-1.27) 4(-8.89,1.27) 5(-6.35,-1.27) 6(-6.35,1.27) 7(-3.81,-1.27) 8(-3.81,1.27) 9(-1.27,-1.27) 10(-1.27,1.27) 11(1.27,-1.27) 12(1.27,1.27) 13(3.81,-1.27) 14(3.81,1.27) 15(6.35,-1.27) 16(6.35,1.27) 17(8.89,-1.27) 18(8.89,1.27) 19(11.43,-1.27) 20(11.43,1.27)
LED0805-R-RD
  rect 1x1.399 smd: 1(1.05,0) 2(-1.05,0)
LED-ARRAY-SMD_6P-L1.6-W1.6-TL
  rect 0.6x0.6 smd: 1(-0.7,0.9) 2(-0.7,0) 3(-0.7,-0.9) 4(0.7,0.9) 5(0.7,0) 6(0.7,-0.9)
LQFP-64_L10.0-W10.0-P0.50-LS12.0-BL
  oval 0.3x2 smd: 1(-3.75,-5.75) 2(-3.25,-5.75) 3(-2.75,-5.75) 4(-2.25,-5.75) 5(-1.75,-5.75) 6(-1.25,-5.75) 7(-0.75,-5.75) 8(-0.25,-5.75) 9(0.25,-5.75) 10(0.75,-5.75) 11(1.25,-5.75) 12(1.75,-5.75) 13(2.25,-5.75) 14(2.75,-5.75) 15(3.25,-5.75) 16(3.75,-5.75) 33(3.75,5.75) 34(3.25,5.75) 35(2.75,5.75) 36(2.25,5.75) 37(1.75,5.75) 38(1.25,5.75) 39(0.75,5.75) 40(0.25,5.75) 41(-0.25,5.75) 42(-0.75,5.75) 43(-1.25,5.75) 44(-1.75,5.75) 45(-2.25,5.75) 46(-2.75,5.75) 47(-3.25,5.75) 48(-3.75,5.75)
  oval 2x0.3 smd: 17(5.75,-3.75) 18(5.75,-3.25) 19(5.75,-2.75) 20(5.75,-2.25) 21(5.75,-1.75) 22(5.75,-1.25) 23(5.75,-0.75) 24(5.75,-0.25) 25(5.75,0.25) 26(5.75,0.75) 27(5.75,1.25) 28(5.75,1.75) 29(5.75,2.25) 30(5.75,2.75) 31(5.75,3.25) 32(5.75,3.75) 49(-5.75,3.75) 50(-5.75,3.25) 51(-5.75,2.75) 52(-5.75,2.25) 53(-5.75,1.75) 54(-5.75,1.25) 55(-5.75,0.75) 56(-5.75,0.25) 57(-5.75,-0.25) 58(-5.75,-0.75) 59(-5.75,-1.25) 60(-5.75,-1.75) 61(-5.75,-2.25) 62(-5.75,-2.75) 63(-5.75,-3.25) 64(-5.75,-3.75)
OSC-SMD_L3.2-W1.5
  rect 1.05x1.7 smd: 1(-1.275,0) 2(1.275,0)
Pad_e439
  round 1.524 hole 0.914: 1(0,0)
Pad_e1911
  round 2.8 hole 1.8: 1(0,0)
Pad_e2120
  round 1.5 hole 0.9: 1(0,0)
R0603
  rect 0.806x0.864 smd: 1(-0.753,0) 2(0.753,0)
R0805
  rect 1.133x1.377 smd: 1(-1,0) 2(1,0)
SOP-8_L4.9-W3.9-P1.27-LS6.0-BL
  oval 0.63x1.865 smd: 1(-1.905,-2.683) 2(-0.635,-2.683) 3(0.635,-2.683) 4(1.905,-2.683) 5(1.905,2.683) 6(0.635,2.683) 7(-0.635,2.683) 8(-1.905,2.683)
SOT-223-4_L6.5-W3.5-P2.30-LS7.0-BR
  rect 2.47x0.98 smd: 1(2.835,-2.3) 2(2.835,0) 3(2.835,2.3)
  rect 2.47x3.6 smd: 4(-2.835,0)
SW-SMD_TS24CA
  rect 0.9x1.2 smd: 1(-2.3,0.775) 2(2.3,0.775)
  rect 1.2x1.3 smd: 3(-1.675,-0.775) 4(1.675,-0.775)
USB-C-SMD_TYPE-C-6PIN-2MD-073
  rect 0.55x1.1 smd: 1(-3.2,2.375) 2(-2.4,2.375) 11(2.4,2.375) 12(3.2,2.375)
  rect 0.3x1.1 smd: 3(-1.75,2.375) 4(-1.25,2.375) 5(-0.75,2.375) 6(-0.25,2.375) 7(0.25,2.375) 8(0.75,2.375) 9(1.25,2.375) 10(1.75,2.375)
  oval 1.1x2 hole 0.6x1.5: 13(-4.325,1.825) 14(4.325,1.825)
  oval 1.2x1.8 hole 0.6x1.2: 13(-4.325,-2.375) 14(4.325,-2.375)

## Nets
As in the schematic, except:
3V3: C1.2 C2.2 C11.2 C12.1 C13.2 C16.2 H15.5 H15.6 LED2.1 NOREF.1 R1.2 R15.2 R16.2 U1.40 U2.5 U2.8 U3.2 U3.4
GND: C1.1 C2.1 C3.1 C4.1 C6.2 C7.2 C8.1 C9.1 C10.2 C11.1 C12.2 C13.1 C14.2 C15.2 C16.1 H13.13 H13.14 H14.17 H14.19 H15.7 H15.8 LED1.1 LED1.2 LED1.3 NOREF#3.1 R2.2 R3.1 R4.1 R6.2 R8.2 SW1.1 SW1.2 SW1.4 SW2.1 SW2.2 SW2.3 U1.41 U2.3 U3.1 USB1.1 USB1.12 USB1.13 USB1.14 X2.2 X2.4
NRST: C4.2 NOREF#2.1 R1.1 SW2.4 U1.38

Pads without a net: U2 4; USB1 3 9

## Via types
v1: diameter 0.61, hole 0.305, Top Layer to Bottom Layer, 50 vias

## Routing (per net, layer and track width the routed paths; a pad name or vN(x,y) marks a point on that pad's centre or on a via; arc(x,y) is an arc through that point)
3V3: length 106
  Top Layer w0.203: 36.74,24.89 35.55,23.69 v1(35.55,23.54)
  Top Layer w0.508: 61.36,9.89 62.98,11.51 62.98,17.32 62.22,18.08 R15.2 ; R1.2 60.95,34.08 61.33,33.7 61.33,30.53 62.22,30.53 62.85,29.89 62.85,19.24 R15.2 ; R15.2 61.43,17.82 61.43,16.81 61.07,16.45 58.26,16.45 57.9,16.81 57.9,17.7 v1(57.52,18.08)
  Bottom Layer w0.254: U2.8 19.29,27.83 19.29,28.62 23.86,33.19 25.77,33.19 27.67,31.29 27.67,30.27 25.73,28.32 24.19,28.32
  Bottom Layer w0.508: C2.2 30.76,22.13 25.91,26.98 ; C1.2 32.74,20.73 v1(35.55,23.54) 53.33,23.54 54.09,22.78 54.09,18.97 54.98,18.08 v1(57.52,18.08) ; v1(17.26,16.43) 16.5,17.19 16.5,23.19 C12.1
+5V: length 67.9
  Top Layer w0.254: USB1.2 7.18,34.44 5.7,34.44 5.45,34.18 5.45,30.14 5.63,29.96 7.13,29.96 USB1.11
  Top Layer w0.508: R19.2 49.9,32.54 49.01,33.43 49.01,39.8 47.74,41.07 v1(38.86,41.07) 19.04,41.07 17.77,39.8 17.77,35.61 16.74,34.58 USB1.2
  Bottom Layer w0.508: H13.15 H13.16 38.85,41.06 v1(38.86,41.07)
GND: length 49.7
  Top Layer w0.254: 36.39,25.24 37.16,26.02 v1(40.37,26.02) v1(42.02,26.02) v1(43.49,26.02) 45.39,26.02 45.84,26.46 v1(45.84,27.64) v1(45.84,29.39) v1(45.84,31.26) v1(45.84,33.18) 45.84,33.57 45.45,33.95 v1(44.46,33.95) ; v1(41.9,33.95) C7.2 ; v1(41.9,33.95) 40.63,33.95 v1(40.37,33.7) v1(40.37,31.96) v1(40.37,30.4) v1(40.37,28.62) ; v1(41.9,33.95) v1(43.18,33.95) v1(44.46,33.95) ; v1(37.96,31.95) 37.95,31.96 36.52,31.96 ; v1(44.46,33.95) 44.46,32.57 C6.2 ; X2.4 34.32,34.85 v1(34.2,34.97)
  Top Layer w0.305: 31.75,29.64 v1(32.75,30.64) v1(32.75,31.88) v1(32.75,33.27) v1(32.75,34.59) 33.13,34.97 v1(34.2,34.97) v1(35.41,34.97) v1(36.83,34.97) 37.53,34.97 v1(37.96,34.54) v1(37.96,33.24) v1(37.96,31.95) v1(37.96,30.76) 38.83,29.89 C9.1
  vias: v1(45.11,26.02) v1(45.33,19.09) v1(56.63,2.08)
NRST: length 36.1
  Top Layer w0.203: SW2.4 56.52,39.53 57.01,39.03 57.01,36.76 C4.2 57.03,34.21 R1.1 v1(55.11,34.08) ; U1.38 38.1,24.83 46.08,24.83 v1(46.58,25.33)
  Bottom Layer w0.203: v1(55.11,34.08) 53.71,34.08 52.95,33.32 52.95,25.57 52.71,25.33 v1(46.58,25.33)
PA0: length 15.9
  Top Layer w0.203: U1.33 39.84,23.03 45.45,23.03 46.49,22 46.49,20.98 H21.2 47.87,22.14 51.3,22.14 51.56,21.88 R13.1
PA1: length 23.3
  Top Layer w0.203: U1.34 39.51,23.42 47.62,23.42 48.76,24.56 48.76,31.03 49.39,31.67 54.22,31.67 54.54,31.34
PA2: length 3
  Top Layer w0.203: U1.42 35,24.56 v1(34.91,24.56)
  Bottom Layer w0.203: 33.72,23.98 34.33,23.98 v1(34.91,24.56)
PA3: length 13.1
  Top Layer w0.254: C6.1 43.42,29.53 43.42,28.49 43.93,27.98 X1.2 43.17,26.84 36.57,26.84 U1.43
PA4: length 10.6
  Top Layer w0.254: U1.44 36.88,27.86 41.64,27.86 X1.1 42.15,27.98 42.66,28.49 42.66,29.64 41.9,30.4 C7.1
PA5: length 9
  Top Layer w0.254: X2.3 35.42,32.56 35.42,30.69 36.4,29.71 36.76,29.71 C9.2 36.83,28.52 34.97,26.66
PA6: length 7
  Top Layer w0.254: 34.32,31.96 34.32,30.08 C8.2 35.17,29.64 35.55,29.25 35.55,27.94 34.62,27.01
PA7: length 15.1
  Top Layer w0.203: H20.2 24.63,19.98 25.57,20.92 26.69,20.92 32.11,26.34 32.11,26.69 U1.49
PA8: length 11.9
  Top Layer w0.203: U1.54 27.67,27.59 27.67,35.71 H13.7
PA9: length 15
  Top Layer w0.203: H13.8 28.69,39.16 27.25,37.72 27.25,27.31 U1.55
PA10: length 63.2
  Top Layer w0.203: v1(26.43,31.54) 26.43,27.42 28.61,25.24
  Bottom Layer w0.203: H15.2 2.66,6.78 2.27,7.16 2.27,12.75 2.64,13.11 24.86,13.11 25.51,13.76 25.51,23.4 20.69,28.23 20.69,28.87 24.37,32.56 25.39,32.56 26.4,31.54 v1(26.43,31.54)
PA11: length 54.7
  Top Layer w0.203: 28.26,24.89 25.87,27.27 v1(25.87,30.4)
  Bottom Layer w0.203: H15.4 5.32,10.59 25.26,10.59 27.04,12.36 27.04,23.68 U2.6 22.09,28.63 22.09,29.25 24.12,31.29 25.01,31.29 25.87,30.42 v1(25.87,30.4)
PA12: length 16.7
  Top Layer w0.203: H14.6 26.15,6.39 25.77,6.78 23.74,6.78 23.48,7.03 23.48,14.46 U1.5
PA13: length 17.6
  Top Layer w0.203: U1.6 24.12,14.39 v1(24.12,7.41)
  Bottom Layer w0.203: H14.5 25.88,2.73 24.88,3.73 24.88,6.78 24.25,7.41 v1(24.12,7.41)
PA14: length 15.5
  Top Layer w0.203: U1.7 24.88,14.44 24.88,8.3 27.91,5.27 H14.8
PA15: length 16.9
  Top Layer w0.203: 28.26,17.11 25.51,14.37 25.51,8.81 27.44,6.88 v1(27.44,6.67)
  Bottom Layer w0.203: v1(27.44,6.67) 27.42,6.65 27.42,4 H14.7
PA16: length 15.4
  Top Layer w0.203: H14.10 29.98,6.52 28.69,6.52 26.15,9.06 26.15,14.3 28.61,16.76
PA17: length 16.7
  Top Layer w0.203: v1(28.94,7.54) 26.78,9.7 26.78,14.22 U1.10
  Bottom Layer w0.203: H14.9 30.7,2.73 29.96,3.47 29.96,6.52 v1(28.94,7.54)
PA18: length 15.8
  Top Layer w0.203: H14.12 33.77,6.32 33.57,6.52 30.85,6.52 27.42,9.95 27.42,14.15 U1.11
PA19: length 27.9
  Top Layer w0.203: U1.12 28,14.03 v1(28,10.33)
  Bottom Layer w0.203: v1(28,10.33) 27.93,10.33 27.17,9.57 6.85,9.57 H15.3
PA20: length 29.6
  Top Layer w0.203: 30.03,15.34 28.69,14.01 v1(28.69,9.57)
  Bottom Layer w0.203: H15.1 6.85,6.78 8.62,8.55 27.67,8.55 v1(28.69,9.57)
PA21: length 16.6
  Top Layer w0.203: H14.16 38.85,9.35 U1.17 33.91,14.42 33.26,15.07 33.26,15.77 v1(33.53,16.03)
  Bottom Layer w0.203: 32.06,17.01 32.56,17.01 v1(33.53,16.03) 34.54,15.02 34.54,14.92
PA22: length 14.9
  Top Layer w0.203: U1.18 40.12,8.78 40.12,4.11 38.85,2.84 H14.15
PA23: length 4.6
  Top Layer w0.203: v1(34.66,17.95) 35.19,17.95 36.39,16.76
  Bottom Layer w0.203: 35.53,15.91 34.66,16.78 v1(34.66,17.95)
PA24: length 7.9
  Top Layer w0.203: v1(37.71,15.67) 37.71,16.15 36.74,17.11
  Bottom Layer w0.203: 40.75,12.87 40.63,12.75 38.6,12.75 37.07,14.27 37.07,15.03 v1(37.71,15.67)
PA25: length 9.1
  Top Layer w0.203: 42.55,11.08 42.55,12.85 38.59,16.81 37.88,16.81 37.23,17.46 U1.26
PA26: length 15.3
  Top Layer w0.203: 38.51,18.88 43.12,14.27 50.28,14.27 51.17,15.16 U4.7
PA27: length 11.3
  Top Layer w0.203: U4.8 42.56,15.54 U1.31
PA28: length 28.3
  Top Layer w0.203: 38.51,23.12 39.18,23.79 47.36,23.79 48.25,24.68 48.25,37.64 46.62,39.27 H13.20
PA29: length 25.1
  Top Layer w0.203: H13.19 43.95,36.75 46.6,36.75 47.74,35.61 47.74,24.94 46.98,24.17 38.86,24.17 38.16,23.47
PA30: length 28.2
  Top Layer w0.203: H13.18 42.66,38 42.66,35.99 43.17,35.48 46.09,35.48 47.23,34.33 47.23,25.19 46.52,24.48 38.46,24.48 U1.37
PA31: length 25.1
  Top Layer w0.203: H13.17 41.39,35.73 42.03,35.1 45.84,35.1 46.72,34.21 46.72,26.46 45.45,25.19 37.75,25.19 U1.39
PB0: length 17.7
  Top Layer w0.203: 44.06,20.87 44.06,21.89 43.8,22.14 39.74,22.14 38.34,20.75 36.94,20.75 32.88,24.81 32.88,25.98 U1.47
PB1: length 18.2
  Top Layer w0.203: U1.48 26.82,20.62 26.02,20.62 23.61,18.21 19.67,18.21 19.66,18.19
PB2: length 12.1
  Top Layer w0.203: U1.50 30.73,27.5 29.2,29.03 29.2,32.56 33.37,36.73 H13.11
PB3: length 15
  Top Layer w0.203: 30.38,27.01 28.82,28.57 28.82,32.76 32.5,36.44 32.5,37.64 33.77,38.91 H13.12
PB4: length 11.9
  Top Layer w0.203: 30.03,26.66 28.44,28.25 28.44,32.94 31.23,35.73 H13.9
PB5: length 15
  Top Layer w0.203: U1.53 28.06,27.92 28.06,33.32 29.96,35.22 29.96,38 H13.10
PB6: length 7.7
  Top Layer w0.203: H20.3 23.53,21.78 23.93,21.38 26.52,21.38 28.56,23.41 28.56,23.88 U1.58
PB7: length 13.9
  Top Layer w0.203: U1.59 25.26,26.47 25.26,35.84 H13.5
PB8: length 17
  Top Layer w0.203: H13.6 26.13,39.27 24.75,37.89 24.75,26.27 U1.60
PB9: length 14.6
  Top Layer w0.203: 26.84,23.47 23.61,26.71 H13.3
PB10: length 18.3
  Top Layer w0.203: H13.4 22.47,38.13 22.47,27.14 26.49,23.12
PB11: length 16.1
  Top Layer w0.203: H13.1 21.2,36.6 21.2,27.71 U1.63
PB12: length 21.3
  Top Layer w0.203: H13.2 19.53,39.27 19.16,38.91 19.16,29.03 U1.64
PB13: length 16.4
  Top Layer w0.203: H14.2 20.94,5.4 20.94,14.75 U1.1
PB14: length 19.2
  Top Layer w0.203: U1.2 21.45,14.55 21.45,6.65 22.21,5.89 22.21,3.87 H14.1
PB15: length 16.1
  Top Layer w0.203: 26.49,18.88 22.09,14.47 22.09,6.79 H14.4
PB16: length 18.2
  Top Layer w0.203: 26.84,18.53 22.85,14.53 v1(22.85,7.16)
  Bottom Layer w0.203: H14.3 22.34,4 22.34,6.65 v1(22.85,7.16)
PB17: length 15.4
  Top Layer w0.203: v1(32.5,7.16) 31.1,7.16 29.32,8.94 29.32,13.94 30.38,14.99
  Bottom Layer w0.203: H14.11 32.5,4 v1(32.5,7.16)
PB18: length 15.2
  Top Layer w0.203: H14.14 36.31,7.41 35.93,7.79 31.23,7.79 29.83,9.19 29.83,13.74 U1.15
PB19: length 16.9
  Top Layer w0.203: U1.16 30.34,13.54 30.34,9.44 31.29,8.49 v1(35.04,8.49)
  Bottom Layer w0.203: v1(35.04,8.49) 35.04,3.35 35.68,2.71 36.29,2.71 H14.13
PB20: length 12.5
  Top Layer w0.203: H14.18 41.39,8.22 34.62,14.99
PB21: length 27.4
  Top Layer w0.203: 34.97,15.34 43.93,6.39 H14.20 54.42,5.27 54.87,4.83 54.87,2.71 SW1.3
PB22: length 16.5
  Top Layer w0.203: U1.21 42.98,8.05 48.5,8.05 U4.2
PB23: length 3.8
  Top Layer w0.203: U1.22 37.06,14.67 38.96,14.67
PB24: length 11
  Top Layer w0.203: U1.23 35.12,17.32 33.9,17.32 32.63,16.05 32.63,14.83 35.04,12.42 35.04,10.33
PB25: length 13.5
  Top Layer w0.203: 32.5,10.33 32.12,10.33 32.12,16.68 34.41,18.97 36.3,18.97 U1.27
PB26: length 14
  Top Layer w0.203: U4.4 45.52,10.46 U1.28
PB27: length 12.8
  Top Layer w0.203: 38.16,18.53 43.68,13 U4.6
USB_D+: length 17.1
  Top Layer w0.203: v1(6.08,30.78) 6.08,31.29 6.22,31.43 USB1.8
  Top Layer w0.254: USB1.8 7.33,31.41 8.24,31.41 8.5,31.67 8.5,32.18 8.25,32.43 USB1.6
  Bottom Layer w0.203: v1(6.08,30.78) 16.34,30.78 U2.1
USB_D-: length 15.5
  Top Layer w0.203: v1(16.88,31.92) 16.5,32.3 9.26,32.3 8.64,32.93 USB1.5
  Top Layer w0.254: USB1.7 7.31,31.92 6.32,31.92 6.14,32.1 6.14,32.76 6.32,32.94 7.3,32.94 USB1.5
  Bottom Layer w0.203: 18.6,30.32 18.48,30.32 v1(16.88,31.92)
$1N5655: length 5.6
  Top Layer w0.508: 61.36,7.79 61.23,7.92 R12.2
$1N5659: length 6.8
  Top Layer w0.381: H5.2 58.28,21.13 57.26,20.11 53.7,20.11 R13.2
$1N5660: length 6.1
  Top Layer w0.508: R14.2 54.61,30.14 56.25,30.14 58.15,28.24 H6.2
$1N5661: length 3.6
  Top Layer w0.508: 52.05,26.59 55.49,26.59 H6.1
$1N5662: length 4.4
  Top Layer w0.508: R15.1 59.69,20.89 H5.3
$1N5663: length 4.3
  Top Layer w0.508: 59.31,30.14 59.31,27.84 H6.3
$1N5664: length 4.9
  Top Layer w0.508: 52.05,23.41 55.49,23.41 55.74,23.16 H5.1
$1N5665: length 6.4
  Top Layer w0.508: 50.41,29.78 50.41,26.72 ; R18.2 R17.2
$1N8212: length 3.7
  Top Layer w0.254: USB1.10 10.18,30.43 10.4,30.65 10.4,31.15 R6.1
$1N8214: length 3.1
  Top Layer w0.254: R8.1 10.39,33.43 USB1.4
$1N9211: length 3.3
  Top Layer w0.508: LED3.2 R4.2
$1N9475: length 5.5
  Top Layer w0.508: LED1.4 58.49,12.99 R11.2
$1N9580: length 3.5
  Top Layer w0.508: U4.1 54.34,7.92 54.48,7.78 54.48,7.67
$1N9585: length 3.3
  Top Layer w0.508: R11.1 54.46,10.46 U4.3
$1N9590: length 3.3
  Top Layer w0.508: U4.5 R10.1
$1N9737: length 4.9
  Top Layer w0.508: LED1.5 56.88,13.89 R10.2
$1N9759: length 5.1
  Top Layer w0.508: R9.2 60.06,15.67 60.49,15.24 LED1.6
$1N18300: length 10
  Top Layer w0.381: H21.3 49.14,19.48 49.65,18.97 54.09,18.97 54.47,18.59 54.47,15.67 R9.1

## Copper pours and planes (outline as drawn; the poured copper is in the pictures)
3V3 on Top Layer: 12.18,16.17 11.93,15.92 10.91,15.92 10.66,15.67 10.66,13.38 10.28,13 3.16,13 2.91,12.75 2.91,11.47 3.54,10.84 18.15,10.84 18.28,10.97 18.28,16.68 18.02,16.94 13.7,16.94 13.45,17.19 13.45,21.51 13.32,21.64 12.43,21.64 12.18,21.38
3V3 on Bottom Layer: 25.77,25.95 26.02,25.95 26.66,26.59 26.66,26.97 24.25,29.38 23.99,29.38 23.23,28.62 23.23,28.49
3V3 on Bottom Layer: 17.51,25.19 17.51,24.94 18.44,24.01 18.72,24.01 20.28,25.57 20.82,25.57 21.83,24.56 22.11,24.56 22.34,24.78 22.34,25.06 20.05,27.35 19.67,27.35
3V3 on Bottom Layer: 30.09,22.02 32.37,19.73 32.63,19.73 33.52,20.62 33.52,20.87 31.23,23.16 30.85,23.16 30.09,22.4
+5V on Top Layer: 8.02,29.48 8.12,29.38 8.12,25.95 7.86,25.7 5.32,25.7 5.19,25.57 5.19,19.06 2.75,19.06 2.53,18.84 2.53,16.43 3.16,15.79 10.28,15.79 11.29,16.81 11.29,29.25 10.4,30.14 6.78,30.14 6.61,29.96 6.61,29.62 6.75,29.48
GND on Top Layer: -12.33,56.05 78.35,56.05 78.35,-21.42 -12.33,-21.42
GND on Bottom Layer: -8.65,51.48 72.25,51.48 72.25,-10.75 -8.65,-10.75
VCORE on Top Layer: 39.61,18.97 39.99,18.97 41.14,20.11 41.14,20.24 40.12,21.25 39.89,21.25 38.72,20.09 38.72,19.86

Small or netless copper shapes (teardrops, artwork), in the pictures only: 197 on Top Layer, 53 on Bottom Layer

## Text on the board
Bottom Silkscreen Layer: Code Composer Studio™
Top Silkscreen Layer: PWR | 3V3 | B12 | B13 | B14 | B11 | B15 | B16 | B10 | B9 | A13 | A12 | B7 | B8 | A15 | A14 | A8 | A9 | B4 | A17 | A16 | B5 | B25 | B2 | A18 | B17 | B3 | B24 | B19 | B18 | A22 | A21 | A30 | A31 | B20 | A28 | A29 | B0 | B21 | A27 | A26 | PA1 | PA0 | B1 | A7 | B6 | A11 | A10 | B27 | B26 | B22 | B23 | A24 | A25 | A0 | 上拉选择 | GND | 5V | DIO | CLK | 2024.8 | NRST | M0G3507
